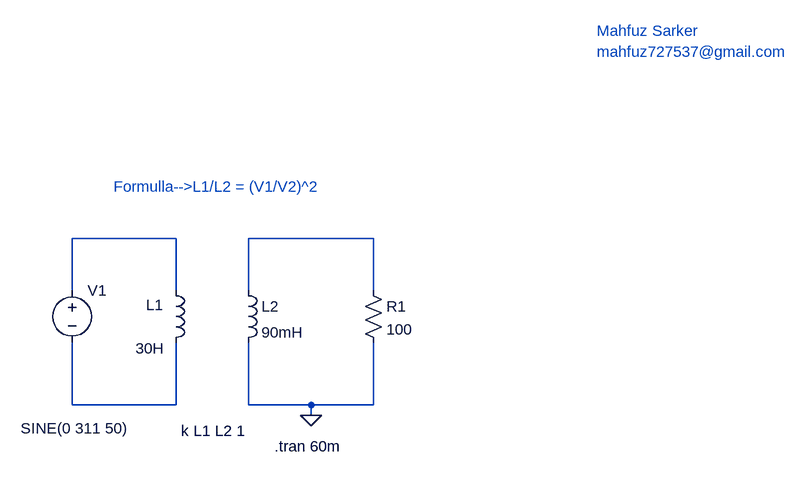
[diagram p0: schematic Transformer in LTspice.asc]
Transformer in LTspice.asc, the LTspice schematic file:
Version 4.1
SHEET 1 1044 680
WIRE 80 48 -80 48
WIRE 384 48 192 48
WIRE -80 128 -80 48
WIRE 80 128 80 48
WIRE 192 128 192 48
WIRE 384 128 384 48
WIRE -80 304 -80 208
WIRE 80 304 80 208
WIRE 80 304 -80 304
WIRE 192 304 192 208
WIRE 288 304 192 304
WIRE 384 304 384 208
WIRE 384 304 288 304
WIRE 288 320 288 304
FLAG 288 320 0
SYMBOL ind 64 112 R0
WINDOW 0 -30 38 Left 2
WINDOW 3 -46 105 Left 2
SYMATTR InstName L1
SYMATTR Value 30H
SYMATTR Type ind
SYMATTR SpiceLine Rser=1m
SYMBOL ind 176 112 R0
SYMATTR InstName L2
SYMATTR Value 90mH
SYMATTR Type ind
SYMATTR SpiceLine Rser=1m
SYMBOL voltage -80 112 R0
WINDOW 3 -79 228 Left 2
WINDOW 123 0 0 Left 0
WINDOW 39 0 0 Left 0
SYMATTR Value SINE(0 311 50)
SYMATTR InstName V1
SYMBOL res 368 112 R0
SYMATTR InstName R1
SYMATTR Value 100
TEXT 88 344 Left 2 !k L1 L2 1
TEXT 232 368 Left 2 !.tran 60m
TEXT -16 -32 Left 2 ;Formulla-->L1/L2 = (V1/V2)^2
TEXT 728 -272 Left 2 ;Mahfuz Sarker
TEXT 728 -240 Left 2 ;mahfuz727537@gmail.com

The netlist it stands for:
* Transformer in LTspice.asc
L1 N001 N003 30H Rser=1m
L2 N002 0 90mH Rser=1m
V1 N001 N003 SINE(0 311 50)
R1 N002 0 100
k L1 L2 1
.tran 60m
* Formulla-->L1/L2 = (V1/V2)^2
* Mahfuz Sarker
* mahfuz727537@gmail.com
.backanno
.end